# Altium schematic sheet CW341_FPGAIO_2.SchDoc: Kintex IO Banks
size Letter; Organization: NewAE Technology Inc.; Address1: 1083 Queen St., Suite 196; Address2: Halifax; Address3: NS; Address4: Canada B3H 0B2; DocumentNumber: .; Revision: .; SheetNumber: 7; SheetTotal: 16; SheetApproved: YES
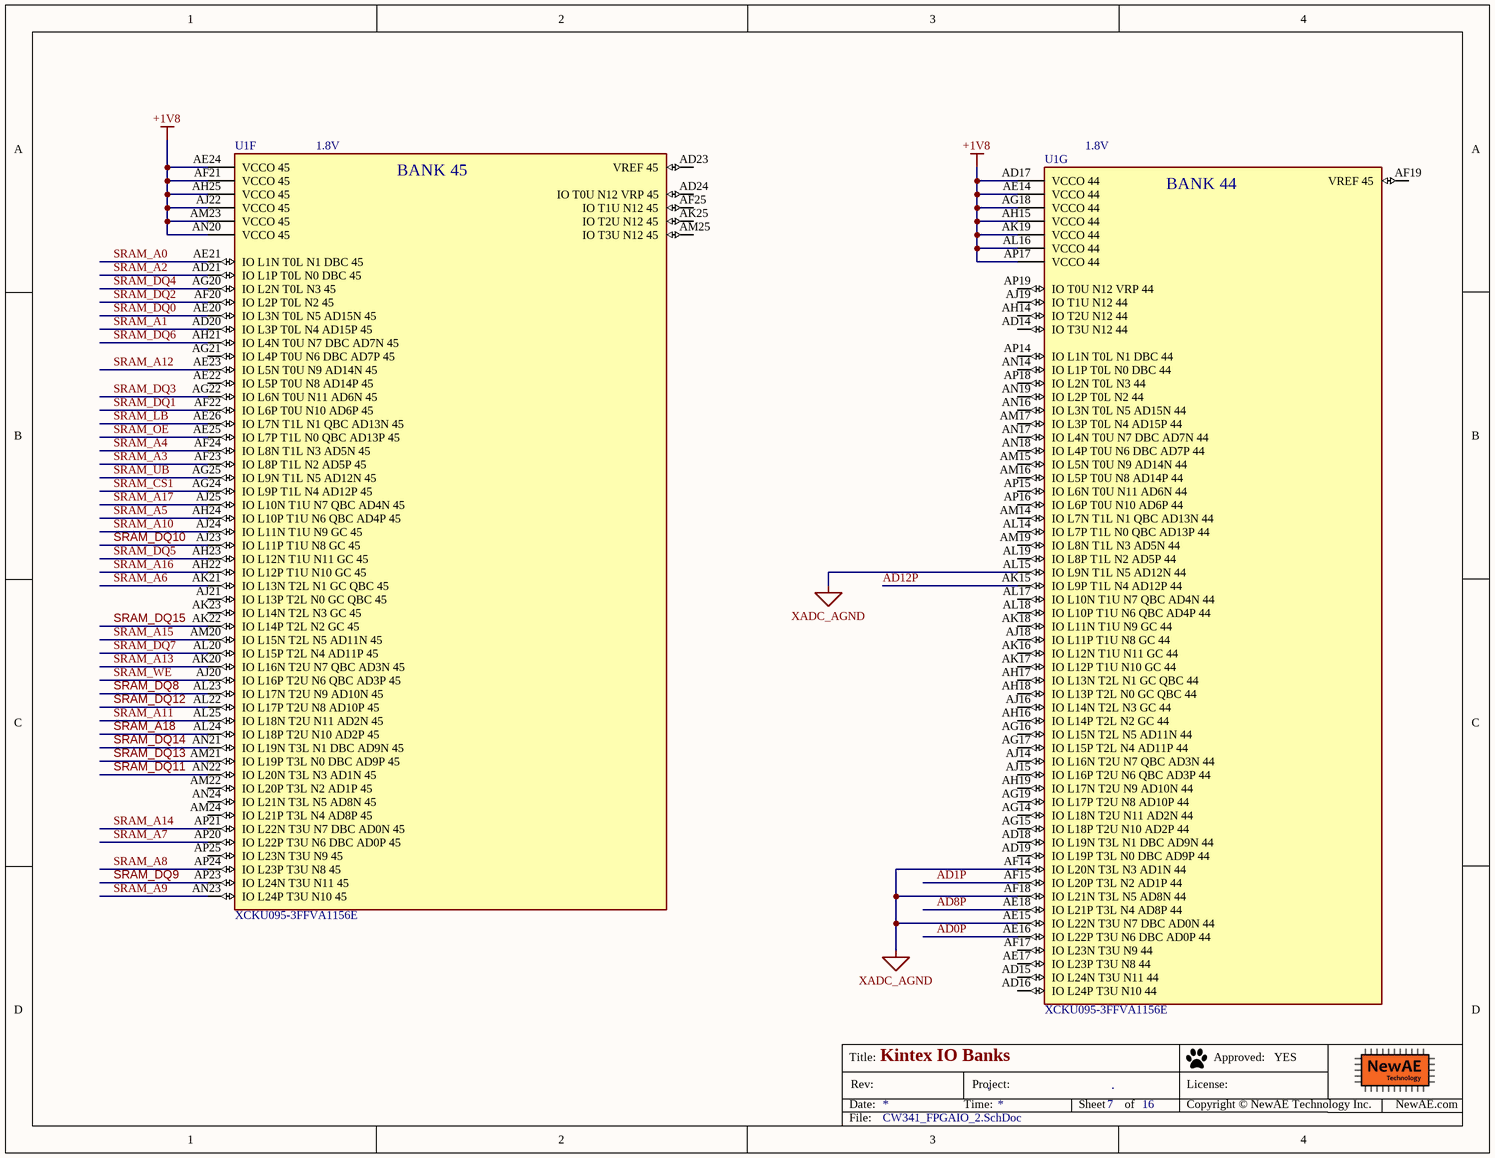
[diagram p0: CW341_FPGAIO_2.SchDoc]

## Parts
U1  XCKU095-3FFVA1156E  [FP-XCKU060-3FFVA1156E-MFG]  (parts F,G of 23)

## Nets
+1V8: U1.AD17(VCCO_44) U1.AE14(VCCO_44) U1.AE24(VCCO_45) U1.AF21(VCCO_45) U1.AG18(VCCO_44) U1.AH15(VCCO_44) U1.AH25(VCCO_45) U1.AJ22(VCCO_45) U1.AK19(VCCO_44) U1.AL16(VCCO_44) U1.AM23(VCCO_45) U1.AN20(VCCO_45) U1.AP17(VCCO_44)
XADC_AGND: U1.AE15(IO_L22N_T3U_N7_DBC_AD0N_44) U1.AF14(IO_L20N_T3L_N3_AD1N_44) U1.AF18(IO_L21N_T3L_N5_AD8N_44) U1.AL15(IO_L9N_T1L_N5_AD12N_44)
AD0P: U1.AE16(IO_L22P_T3U_N6_DBC_AD0P_44)
AD1P: U1.AF15(IO_L20P_T3L_N2_AD1P_44)
AD8P: U1.AE18(IO_L21P_T3L_N4_AD8P_44)
AD12P: U1.AK15(IO_L9P_T1L_N4_AD12P_44)
SRAM_A0: U1.AE21(IO_L1N_T0L_N1_DBC_45)
SRAM_A1: U1.AD20(IO_L3P_T0L_N4_AD15P_45)
SRAM_A2: U1.AD21(IO_L1P_T0L_N0_DBC_45)
SRAM_A3: U1.AF23(IO_L8P_T1L_N2_AD5P_45)
SRAM_A4: U1.AF24(IO_L8N_T1L_N3_AD5N_45)
SRAM_A5: U1.AH24(IO_L10P_T1U_N6_QBC_AD4P_45)
SRAM_A6: U1.AK21(IO_L13N_T2L_N1_GC_QBC_45)
SRAM_A7: U1.AP20(IO_L22P_T3U_N6_DBC_AD0P_45)
SRAM_A8: U1.AP24(IO_L23P_T3U_N8_45)
SRAM_A9: U1.AN23(IO_L24P_T3U_N10_45)
SRAM_A10: U1.AJ24(IO_L11N_T1U_N9_GC_45)
SRAM_A11: U1.AL25(IO_L18N_T2U_N11_AD2N_45)
SRAM_A12: U1.AE23(IO_L5N_T0U_N9_AD14N_45)
SRAM_A13: U1.AK20(IO_L16N_T2U_N7_QBC_AD3N_45)
SRAM_A14: U1.AP21(IO_L22N_T3U_N7_DBC_AD0N_45)
SRAM_A15: U1.AM20(IO_L15N_T2L_N5_AD11N_45)
SRAM_A16: U1.AH22(IO_L12P_T1U_N10_GC_45)
SRAM_A17: U1.AJ25(IO_L10N_T1U_N7_QBC_AD4N_45)
SRAM_A18: U1.AL24(IO_L18P_T2U_N10_AD2P_45)
SRAM_~{CS1}: U1.AG24(IO_L9P_T1L_N4_AD12P_45)
SRAM_DQ0: U1.AE20(IO_L3N_T0L_N5_AD15N_45)
SRAM_DQ1: U1.AF22(IO_L6P_T0U_N10_AD6P_45)
SRAM_DQ2: U1.AF20(IO_L2P_T0L_N2_45)
SRAM_DQ3: U1.AG22(IO_L6N_T0U_N11_AD6N_45)
SRAM_DQ4: U1.AG20(IO_L2N_T0L_N3_45)
SRAM_DQ5: U1.AH23(IO_L12N_T1U_N11_GC_45)
SRAM_DQ6: U1.AH21(IO_L4N_T0U_N7_DBC_AD7N_45)
SRAM_DQ7: U1.AL20(IO_L15P_T2L_N4_AD11P_45)
SRAM_DQ8: U1.AL23(IO_L17N_T2U_N9_AD10N_45)
SRAM_DQ9: U1.AP23(IO_L24N_T3U_N11_45)
SRAM_DQ10: U1.AJ23(IO_L11P_T1U_N8_GC_45)
SRAM_DQ11: U1.AN22(IO_L20N_T3L_N3_AD1N_45)
SRAM_DQ12: U1.AL22(IO_L17P_T2U_N8_AD10P_45)
SRAM_DQ13: U1.AM21(IO_L19P_T3L_N0_DBC_AD9P_45)
SRAM_DQ14: U1.AN21(IO_L19N_T3L_N1_DBC_AD9N_45)
SRAM_DQ15: U1.AK22(IO_L14P_T2L_N2_GC_45)
SRAM_~{LB}: U1.AE26(IO_L7N_T1L_N1_QBC_AD13N_45)
SRAM_~{OE}: U1.AE25(IO_L7P_T1L_N0_QBC_AD13P_45)
SRAM_~{UB}: U1.AG25(IO_L9N_T1L_N5_AD12N_45)
SRAM_~{WE}: U1.AJ20(IO_L16P_T2U_N6_QBC_AD3P_45)

Not connected (* = marked no-connect by the designer): U1 AD14(IO_T3U_N12_44) AD15(IO_L24N_T3U_N11_44) AD16(IO_L24P_T3U_N10_44) AD18(IO_L19N_T3L_N1_DBC_AD9N_44) AD19(IO_L19P_T3L_N0_DBC_AD9P_44) AD23(VREF_45) AD24(IO_T0U_N12_VRP_45) AE17(IO_L23P_T3U_N8_44) AE22(IO_L5P_T0U_N8_AD14P_45) AF17(IO_L23N_T3U_N9_44) AF19(VREF_45) AF25(IO_T1U_N12_45) AG14(IO_L18N_T2U_N11_AD2N_44) AG15(IO_L18P_T2U_N10_AD2P_44) AG16(IO_L15N_T2L_N5_AD11N_44) AG17(IO_L15P_T2L_N4_AD11P_44) AG19(IO_L17P_T2U_N8_AD10P_44) AG21(IO_L4P_T0U_N6_DBC_AD7P_45) AH14(IO_T2U_N12_44) AH16(IO_L14P_T2L_N2_GC_44) AH17(IO_L13N_T2L_N1_GC_QBC_44) AH18(IO_L13P_T2L_N0_GC_QBC_44) AH19(IO_L17N_T2U_N9_AD10N_44) AJ14(IO_L16N_T2U_N7_QBC_AD3N_44) AJ15(IO_L16P_T2U_N6_QBC_AD3P_44) AJ16(IO_L14N_T2L_N3_GC_44) AJ18(IO_L11P_T1U_N8_GC_44) AJ19(IO_T1U_N12_44) AJ21(IO_L13P_T2L_N0_GC_QBC_45) AK16(IO_L12N_T1U_N11_GC_44) AK17(IO_L12P_T1U_N10_GC_44) AK18(IO_L11N_T1U_N9_GC_44) AK23(IO_L14N_T2L_N3_GC_45) AK25(IO_T2U_N12_45) AL14(IO_L7P_T1L_N0_QBC_AD13P_44) AL17(IO_L10N_T1U_N7_QBC_AD4N_44) AL18(IO_L10P_T1U_N6_QBC_AD4P_44) AL19(IO_L8P_T1L_N2_AD5P_44) AM14(IO_L7N_T1L_N1_QBC_AD13N_44) AM15(IO_L5N_T0U_N9_AD14N_44) AM16(IO_L5P_T0U_N8_AD14P_44) AM17(IO_L3P_T0L_N4_AD15P_44) AM19(IO_L8N_T1L_N3_AD5N_44) AM22(IO_L20P_T3L_N2_AD1P_45) AM24(IO_L21P_T3L_N4_AD8P_45) AM25(IO_T3U_N12_45) AN14(IO_L1P_T0L_N0_DBC_44) AN16(IO_L3N_T0L_N5_AD15N_44) AN17(IO_L4N_T0U_N7_DBC_AD7N_44) AN18(IO_L4P_T0U_N6_DBC_AD7P_44) AN19(IO_L2P_T0L_N2_44) AN24(IO_L21N_T3L_N5_AD8N_45) AP14(IO_L1N_T0L_N1_DBC_44) AP15(IO_L6N_T0U_N11_AD6N_44) AP16(IO_L6P_T0U_N10_AD6P_44) AP18(IO_L2N_T0L_N3_44) AP19(IO_T0U_N12_VRP_44) AP25(IO_L23N_T3U_N9_45)

## Notes on the sheet
- (near U1) 1.8V
- Title:
- Date:
- Rev:
- Time:
- Project:
- Sheet
- of
- License:
- Copyright © NewAE Technology Inc.
- Approved:
- NewAE.com
- File:
- (in symbol IC-XCKU095-1156, part F) BANK 45
- (in symbol IC-XCKU095-1156, part G) BANK 44

## Library data of the parts
U1 = IC-XCKU095-1156: IC FPGA 520 I/O 1156FCBGA; Manufacturer: Xilinx; Manufacturer Part Number: XCKU060-3FFVA1156E; Standoff Height: 0.4mm; Ram Size: 38MBytes; Min Supply Voltage: 0.97V; Max Junction Temp: +100°C; Max Supply Voltage: 1.8V; Number Of Logic Elements Cells: 1176000; Number Of I/Os: 520; Speed Grade: 3; Memory Type: RAM; Ipc Land Pattern Name: BGA1156N100P34X34_3500X3500X342; RoHS: TRUE; Height: 3.51mm; Footprint Url: https://www.xilinx.com/support/documentation/user_guides/ug575-ultrascale-pkg-pinout.pdf; Device Class L2: Embedded Processors and Controllers; ComponentLink2URL: https://www.xilinx.com/support/documentation/data_sheets/ds890-ultrascale-overview.pdf; Temperature Range High: +100°C; Device Class L1: Integrated Circuits (ICs); Package: 0; Octopart: https://octopart.com/xcku035-3ffva1156e-xilinx-67038192?r=sp; Automotive: No; ComponentLink2Description: Datasheet; Device Class L3: FPGAs - Field Programmable Gate Arrays; Category: IC; Lead Free: Yes; Temperature: 0°C to +100°C; Temperature Range Low: 0°C; Digikey Description: IC FPGA 520 I/O 1156FCBGA